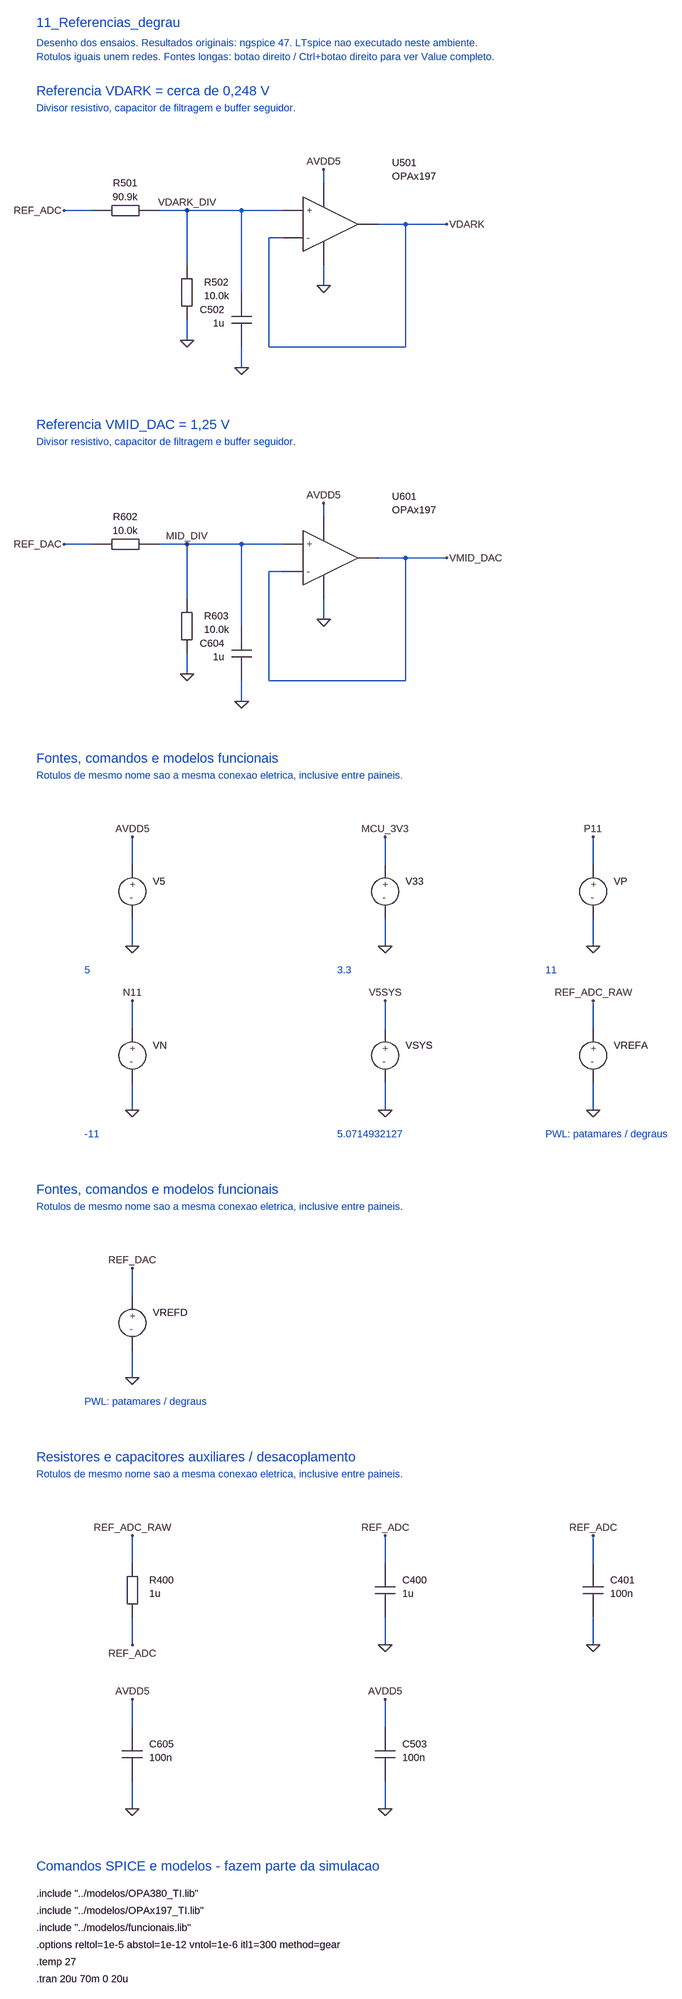
[diagram p0: schematic 11_Referencias_degrau.asc]
11_Referencias_degrau.asc, the LTspice schematic file:
Version 4.1
SHEET 1 1968 5584
TEXT 64 32 Left 3 ;11_Referencias_degrau
TEXT 64 80 Left 2 ;Desenho dos ensaios. Resultados originais: ngspice 47. LTspice nao executado neste ambiente.
TEXT 64 112 Left 2 ;Rotulos iguais unem redes. Fontes longas: botao direito / Ctrl+botao direito para ver Value completo.
TEXT 64 192 Left 3 ;Referencia VDARK = cerca de 0,248 V
TEXT 64 232 Left 2 ;Divisor resistivo, capacitor de filtragem e buffer seguidor.
WIRE 192 544 128 544
WIRE 352 544 640 544
WIRE 416 544 416 672
WIRE 416 800 416 848
WIRE 544 544 544 736
WIRE 544 864 544 912
WIRE 736 480 736 448
WIRE 736 672 736 720
WIRE 640 608 608 608
WIRE 608 608 608 864
WIRE 608 864 928 864
WIRE 928 864 928 576
WIRE 928 576 864 576
WIRE 928 576 1024 576
FLAG 128 544 REF_ADC
FLAG 416 848 0
FLAG 544 912 0
FLAG 736 448 AVDD5
FLAG 736 720 0
FLAG 1024 576 VDARK
FLAG 416 544 VDARK_DIV
SYMBOL CV_RH 192 544 R0
SYMATTR InstName R501
SYMATTR Value 90.9k
SYMBOL CV_RV 416 672 R0
SYMATTR InstName R502
SYMATTR Value 10.0k
SYMBOL CV_CVL 544 736 R0
SYMATTR InstName C502
SYMATTR Value 1u
SYMBOL CV_OPF 704 512 R0
SYMATTR InstName U501
SYMATTR Value OPAx197
TEXT 64 1152 Left 3 ;Referencia VMID_DAC = 1,25 V
TEXT 64 1192 Left 2 ;Divisor resistivo, capacitor de filtragem e buffer seguidor.
WIRE 192 1504 128 1504
WIRE 352 1504 640 1504
WIRE 416 1504 416 1632
WIRE 416 1760 416 1808
WIRE 544 1504 544 1696
WIRE 544 1824 544 1872
WIRE 736 1440 736 1408
WIRE 736 1632 736 1680
WIRE 640 1568 608 1568
WIRE 608 1568 608 1824
WIRE 608 1824 928 1824
WIRE 928 1824 928 1536
WIRE 928 1536 864 1536
WIRE 928 1536 1024 1536
FLAG 128 1504 REF_DAC
FLAG 416 1808 0
FLAG 544 1872 0
FLAG 736 1408 AVDD5
FLAG 736 1680 0
FLAG 1024 1536 VMID_DAC
FLAG 416 1504 MID_DIV
SYMBOL CV_RH 192 1504 R0
SYMATTR InstName R602
SYMATTR Value 10.0k
SYMBOL CV_RV 416 1632 R0
SYMATTR InstName R603
SYMATTR Value 10.0k
SYMBOL CV_CVL 544 1696 R0
SYMATTR InstName C604
SYMATTR Value 1u
SYMBOL CV_OPF 704 1472 R0
SYMATTR InstName U601
SYMATTR Value OPAx197
TEXT 64 2112 Left 3 ;Fontes, comandos e modelos funcionais
TEXT 64 2152 Left 2 ;Rotulos de mesmo nome sao a mesma conexao eletrica, inclusive entre paineis.
WIRE 288 2432 288 2368
WIRE 288 2560 288 2624
WIRE 880 2432 880 2368
WIRE 880 2560 880 2624
WIRE 1472 2432 1472 2368
WIRE 1472 2560 1472 2624
WIRE 288 2816 288 2752
WIRE 288 2944 288 3008
WIRE 880 2816 880 2752
WIRE 880 2944 880 3008
WIRE 1472 2816 1472 2752
WIRE 1472 2944 1472 3008
FLAG 288 2368 AVDD5
FLAG 288 2624 0
FLAG 880 2368 MCU_3V3
FLAG 880 2624 0
FLAG 1472 2368 P11
FLAG 1472 2624 0
FLAG 288 2752 N11
FLAG 288 3008 0
FLAG 880 2752 V5SYS
FLAG 880 3008 0
FLAG 1472 2752 REF_ADC_RAW
FLAG 1472 3008 0
SYMBOL CV_V 288 2432 R0
SYMATTR InstName V5
SYMATTR Value 5
SYMBOL CV_V 880 2432 R0
SYMATTR InstName V33
SYMATTR Value 3.3
SYMBOL CV_V 1472 2432 R0
SYMATTR InstName VP
SYMATTR Value 11
SYMBOL CV_V 288 2816 R0
SYMATTR InstName VN
SYMATTR Value -11
SYMBOL CV_V 880 2816 R0
SYMATTR InstName VSYS
SYMATTR Value 5.0714932127
SYMBOL CV_V 1472 2816 R0
SYMATTR InstName VREFA
SYMATTR Value PWL(0 2.5 10m 2.5 10.01m 2.4 40m 2.4 40.01m 2.5)
TEXT 176 2680 Left 2 ;5
TEXT 768 2680 Left 2 ;3.3
TEXT 1360 2680 Left 2 ;11
TEXT 176 3064 Left 2 ;-11
TEXT 768 3064 Left 2 ;5.0714932127
TEXT 1360 3064 Left 2 ;PWL: patamares / degraus
TEXT 64 3264 Left 3 ;Fontes, comandos e modelos funcionais
TEXT 64 3304 Left 2 ;Rotulos de mesmo nome sao a mesma conexao eletrica, inclusive entre paineis.
WIRE 288 3584 288 3520
WIRE 288 3712 288 3776
FLAG 288 3520 REF_DAC
FLAG 288 3776 0
SYMBOL CV_V 288 3584 R0
SYMATTR InstName VREFD
SYMATTR Value PWL(0 2.5 10m 2.5 10.01m 2.4 40m 2.4 40.01m 2.5)
TEXT 176 3832 Left 2 ;PWL: patamares / degraus
TEXT 64 4032 Left 3 ;Resistores e capacitores auxiliares / desacoplamento
TEXT 64 4072 Left 2 ;Rotulos de mesmo nome sao a mesma conexao eletrica, inclusive entre paineis.
WIRE 288 4352 288 4288
WIRE 288 4480 288 4544
WIRE 880 4352 880 4288
WIRE 880 4480 880 4544
WIRE 1472 4352 1472 4288
WIRE 1472 4480 1472 4544
WIRE 288 4736 288 4672
WIRE 288 4864 288 4928
WIRE 880 4736 880 4672
WIRE 880 4864 880 4928
FLAG 288 4288 REF_ADC_RAW
FLAG 288 4544 REF_ADC
FLAG 880 4288 REF_ADC
FLAG 880 4544 0
FLAG 1472 4288 REF_ADC
FLAG 1472 4544 0
FLAG 288 4672 AVDD5
FLAG 288 4928 0
FLAG 880 4672 AVDD5
FLAG 880 4928 0
SYMBOL CV_RV 288 4352 R0
SYMATTR InstName R400
SYMATTR Value 1u
SYMBOL CV_CV 880 4352 R0
SYMATTR InstName C400
SYMATTR Value 1u
SYMBOL CV_CV 1472 4352 R0
SYMATTR InstName C401
SYMATTR Value 100n
SYMBOL CV_CV 288 4736 R0
SYMATTR InstName C605
SYMATTR Value 100n
SYMBOL CV_CV 880 4736 R0
SYMATTR InstName C503
SYMATTR Value 100n
TEXT 64 5184 Left 3 ;Comandos SPICE e modelos - fazem parte da simulacao
TEXT 64 5248 Left 2 !.include "../modelos/OPA380_TI.lib"
TEXT 64 5288 Left 2 !.include "../modelos/OPAx197_TI.lib"
TEXT 64 5328 Left 2 !.include "../modelos/funcionais.lib"
TEXT 64 5368 Left 2 !.options reltol=1e-5 abstol=1e-12 vntol=1e-6 itl1=300 method=gear
TEXT 64 5408 Left 2 !.temp 27
TEXT 64 5448 Left 2 !.tran 20u 70m 0 20u

The netlist it stands for:
* 11_Referencias_degrau.asc
R501 REF_ADC VDARK_DIV 90.9k
R502 VDARK_DIV 0 10.0k
C502 VDARK_DIV 0 1u
X§U501 VDARK_DIV VDARK AVDD5 0 VDARK OPAx197  ; pins + - V+ V- OUT
R602 REF_DAC MID_DIV 10.0k
R603 MID_DIV 0 10.0k
C604 MID_DIV 0 1u
X§U601 MID_DIV VMID_DAC AVDD5 0 VMID_DAC OPAx197  ; pins + - V+ V- OUT
V5 AVDD5 0 5
V33 MCU_3V3 0 3.3
VP P11 0 11
VN N11 0 -11
VSYS V5SYS 0 5.0714932127
VREFA REF_ADC_RAW 0 PWL(0 2.5 10m 2.5 10.01m 2.4 40m 2.4 40.01m 2.5)
VREFD REF_DAC 0 PWL(0 2.5 10m 2.5 10.01m 2.4 40m 2.4 40.01m 2.5)
R400 REF_ADC_RAW REF_ADC 1u
C400 REF_ADC 0 1u
C401 REF_ADC 0 100n
C605 AVDD5 0 100n
C503 AVDD5 0 100n
* 11_Referencias_degrau
* Desenho dos ensaios. Resultados originais: ngspice 47. LTspice nao executado neste ambiente.
* Rotulos iguais unem redes. Fontes longas: botao direito / Ctrl+botao direito para ver Value completo.
* Referencia VDARK = cerca de 0,248 V
* Divisor resistivo, capacitor de filtragem e buffer seguidor.
* Referencia VMID_DAC = 1,25 V
* Divisor resistivo, capacitor de filtragem e buffer seguidor.
* Fontes, comandos e modelos funcionais
* Rotulos de mesmo nome sao a mesma conexao eletrica, inclusive entre paineis.
* 5
* 3.3
* 11
* -11
* 5.0714932127
* PWL: patamares / degraus
* Fontes, comandos e modelos funcionais
* Rotulos de mesmo nome sao a mesma conexao eletrica, inclusive entre paineis.
* PWL: patamares / degraus
* Resistores e capacitores auxiliares / desacoplamento
* Rotulos de mesmo nome sao a mesma conexao eletrica, inclusive entre paineis.
* Comandos SPICE e modelos - fazem parte da simulacao
.include "../modelos/OPA380_TI.lib"
.include "../modelos/OPAx197_TI.lib"
.include "../modelos/funcionais.lib"
.options reltol=1e-5 abstol=1e-12 vntol=1e-6 itl1=300 method=gear
.temp 27
.tran 20u 70m 0 20u
.backanno
.end